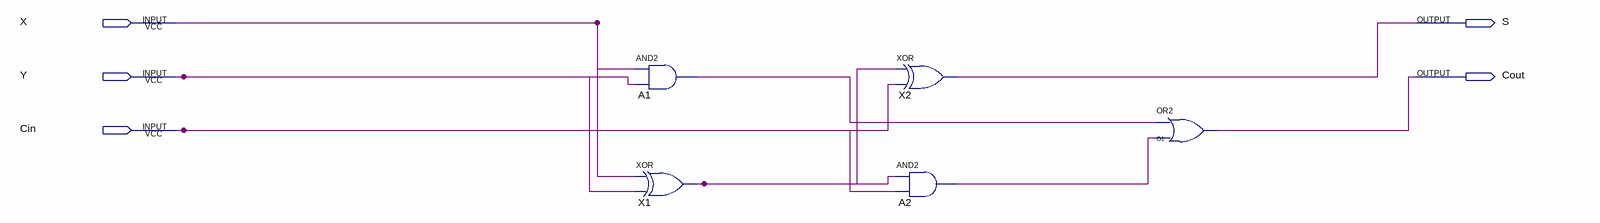
[diagram p0: schematic sheet]
// Quartus schematic fa1.bdf as structural Verilog: 5 symbols, 5 pins
module fa1 (
  input  X,
  input  Y,
  input  Cin,
  output S,
  output Cout
);

  wire A1_out, A2_out, X1_out;

  and A1 (A1_out, X, Y);
  xor X1 (X1_out, X, Y);
  xor X2 (S, X1_out, Cin);
  and A2 (A2_out, X1_out, Cin);
  or O1 (Cout, A1_out, A2_out);
endmodule
